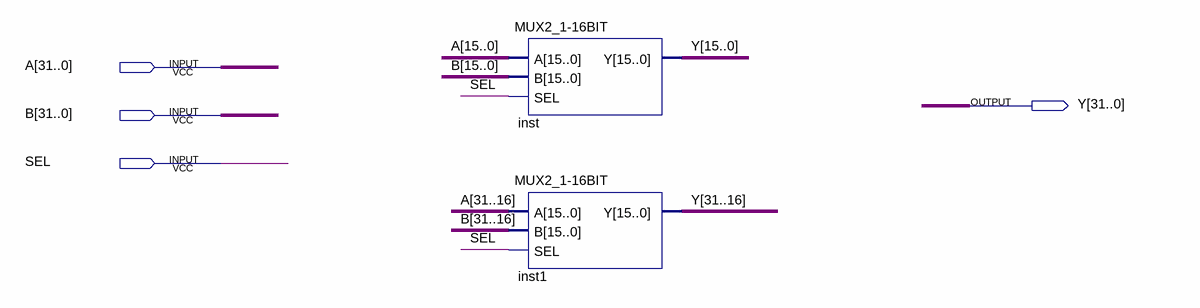
[diagram p0: schematic sheet]
// Quartus schematic MUX32to1.bdf as structural Verilog: 2 symbols, 4 pins
module MUX32to1 (
  input  [31:0] A,
  input  [31:0] B,
  input  SEL,
  output [31:0] Y
);

  \MUX2_1-16BIT  inst (.A(A[15:0]), .B(B[15:0]), .SEL(SEL), .Y(Y[15:0]));
  \MUX2_1-16BIT  inst1 (.A(A[31:16]), .B(B[31:16]), .SEL(SEL), .Y(Y[31:16]));
endmodule
